# Altium schematic sheet R6 Schematic.SchDoc
size A4; SheetNumber: 1; SheetTotal: 1
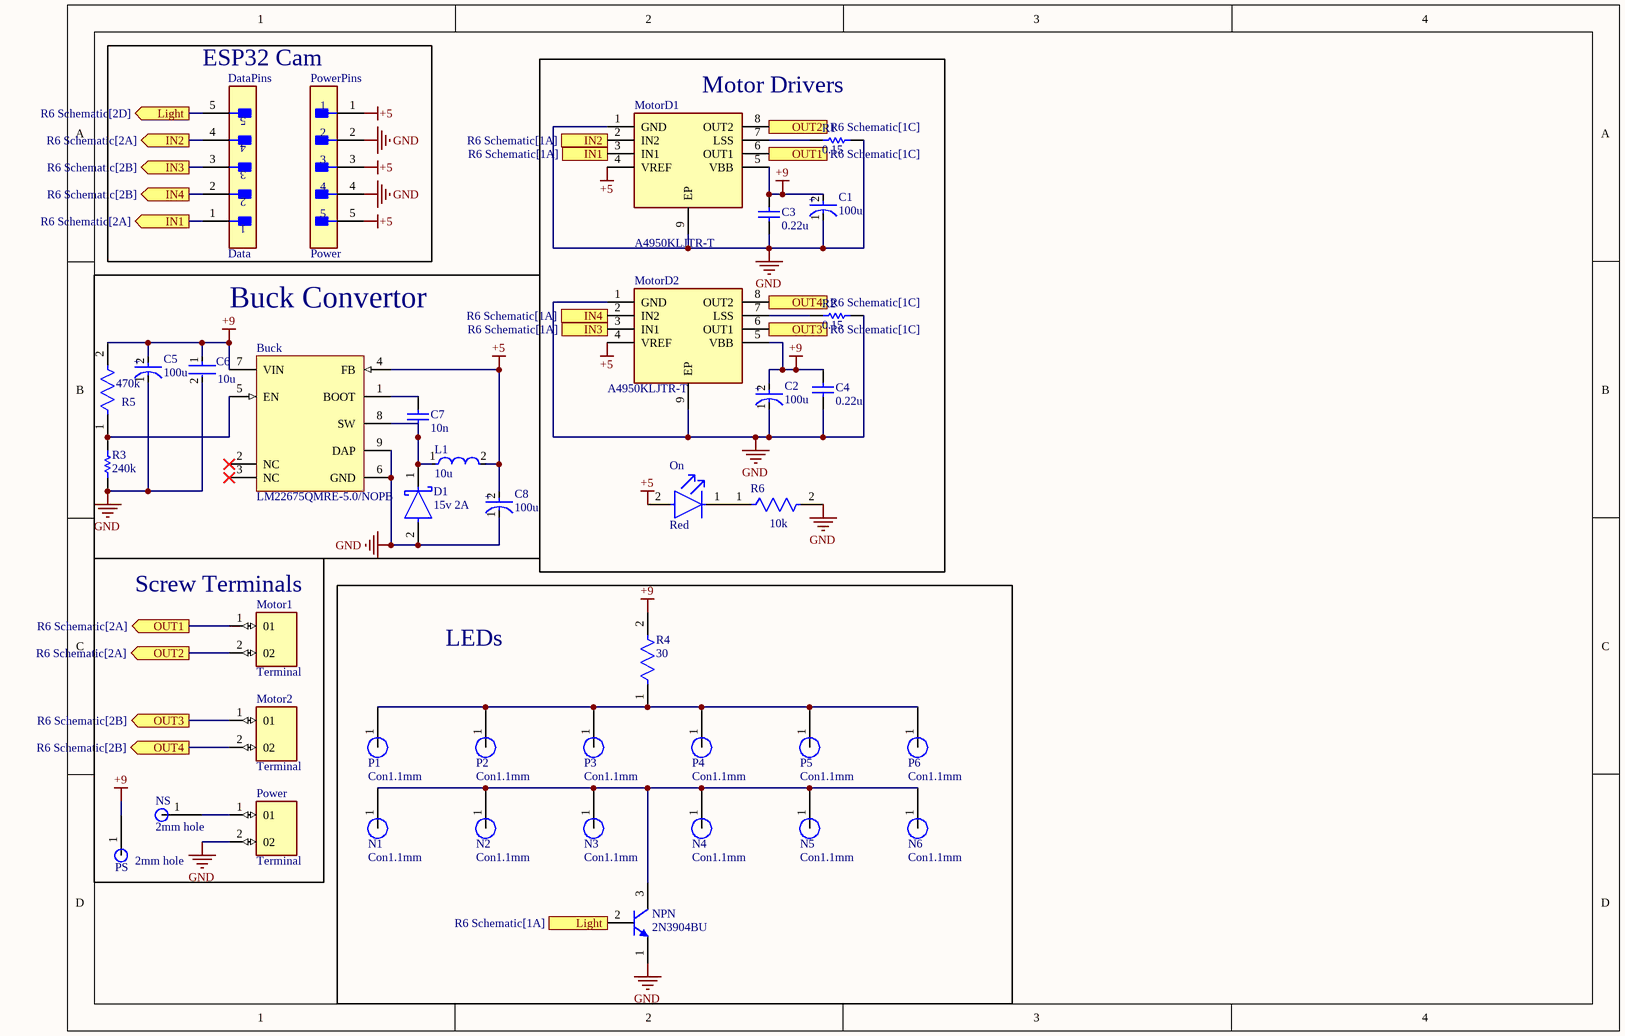
[diagram p0: R6 Schematic.SchDoc]

## Parts
Buck  LM22675QMRE-5.0/NOPB  [MRA08B_L]
C1  100u  [FP-FTB-MFG]
C2  100u  [FP-FTB-MFG]
C3  0.22u  [CAPC2013X94X50LL20T25]
C4  0.22u  [CAPC2013X94X50LL20T25]
C5  100u  [FP-FTB-MFG]
C6  10u  [FP-1210-L_3_3_0_4-W_2_5_0-IPC_A]
C7  10n  [CAPC1608X90X35ML15T15]
C8  100u  [FP-FTB-MFG]
D1  15v 2A  [FP-425AB-MFG]
DataPins  Data  [FP-22-28-4050-MFG]
L1  10u  [FP-IHLP-3232CZ-FP_2_413x5-MFG]
Motor1  Terminal  [EBBA-02-C-SS-BU]
Motor2  Terminal  [EBBA-02-C-SS-BU]
MotorD1  A4950KLJTR-T  [SOIC127P600X170-9N]
MotorD2  A4950KLJTR-T  [SOIC127P600X170-9N]
N1  Con1.1mm  [PCBComponent_1 - duplicate]
N2  Con1.1mm  [PCBComponent_1 - duplicate]
N3  Con1.1mm  [PCBComponent_1 - duplicate]
N4  Con1.1mm  [PCBComponent_1 - duplicate]
N5  Con1.1mm  [PCBComponent_1 - duplicate]
N6  Con1.1mm  [PCBComponent_1 - duplicate]
NPN  2N3904BU  [FAIR-TO-92]
NS  2mm hole  [PCBComponent_1]
On  Red  [FP-HSMC-C280-MFG]
P1  Con1.1mm  [PCBComponent_1 - duplicate]
P2  Con1.1mm  [PCBComponent_1 - duplicate]
P3  Con1.1mm  [PCBComponent_1 - duplicate]
P4  Con1.1mm  [PCBComponent_1 - duplicate]
P5  Con1.1mm  [PCBComponent_1 - duplicate]
P6  Con1.1mm  [PCBComponent_1 - duplicate]
Power  Terminal  [EBBA-02-C-SS-BU]
PowerPins  Power  [FP-22-28-4050-MFG]
PS  2mm hole  [PCBComponent_1]
R1  0.15  [RESC3216X89X64LL25T25]
R2  0.15  [RESC3216X89X64LL25T25]
R3  240k  [RESC0805(2012)_L]
R4  30  [FP-RMCF0805-IPC_B]
R5  470k  [FP-AT0805-IPC_C]
R6  10k  [FP-RQ731J-IPC_B]

## Blocks framed on the sheet
ESP32 Cam: DataPins PowerPins
Motor Drivers: C1-C4 MotorD1 MotorD2 On R1 R2 R6
Buck Convertor: Buck C5-C8 D1 L1 R3 R5
Screw Terminals: Motor1 Motor2 NS Power PS
LEDs: N1-N6 NPN P1-P6 R4

## Ports
IN1 (in, see R6 Schematic[1A]), IN1 (out, see R6 Schematic[2A]), IN2 (in, see R6 Schematic[1A]), IN2 (out, see R6 Schematic[2A]), IN3 (in, see R6 Schematic[1A]), IN3 (out, see R6 Schematic[2B]), IN4 (in, see R6 Schematic[1A]), IN4 (out, see R6 Schematic[2B]), Light (in, see R6 Schematic[1A]), Light (out, see R6 Schematic[2D]), OUT1 (out, see R6 Schematic[1C]), OUT1 (out, see R6 Schematic[2A]), OUT2 (out, see R6 Schematic[1C]), OUT2 (out, see R6 Schematic[2A]), OUT3 (out, see R6 Schematic[1C]), OUT3 (out, see R6 Schematic[2B]), OUT4 (out, see R6 Schematic[1C]), OUT4 (out, see R6 Schematic[2B])

## Nets
+5: Buck.4(FB) C8.2(A) L1.2 MotorD1.4(VREF) MotorD2.4(VREF) On.2(A) PowerPins.1 PowerPins.3 PowerPins.5
+9: Buck.7(VIN) C1.2(A) C2.2(A) C3.2 C4.2 C5.2(A) C6.1 MotorD1.5(VBB) MotorD2.5(VBB) PS.1 R4.2 R5.2
GND: Buck.6(GND) Buck.9(DAP) C1.1(C) C2.1(C) C3.1 C4.1 C5.1(C) C6.2 C8.1(C) D1.2(A) MotorD1.1(GND) MotorD1.9(EP) MotorD2.1(GND) MotorD2.9(EP) NPN.1(E) Power.2(02) PowerPins.2 PowerPins.4 R1.2 R2.2 R3.1 R6.2
IN1: DataPins.1 MotorD1.3(IN1) ; port IN1
IN2: DataPins.4 MotorD1.2(IN2) ; port IN2
IN3: DataPins.3 MotorD2.3(IN1) ; port IN3
IN4: DataPins.2 MotorD2.2(IN2) ; port IN4
Light: DataPins.5 NPN.2(B) ; port Light
OUT1: Motor1.1(01) MotorD1.6(OUT1) ; port OUT1
OUT2: Motor1.2(02) MotorD1.8(OUT2) ; port OUT2
OUT3: Motor2.1(01) MotorD2.6(OUT1) ; port OUT3
OUT4: Motor2.2(02) MotorD2.8(OUT2) ; port OUT4
NetBuck_1: Buck.1(BOOT) C7.2
NetBuck_5: Buck.5(EN) R3.2 R5.1
NetBuck_8: Buck.8(SW) C7.1 D1.1(C) L1.1
NetMotorD1_7: MotorD1.7(LSS) R1.1
NetMotorD2_7: MotorD2.7(LSS) R2.1
NetN1_1: N1.1 N2.1 N3.1 N4.1 N5.1 N6.1 NPN.3(C)
NetNS_1: NS.1 Power.1(01)
NetOn_1: On.1(C) R6.1
NetP1_1: P1.1 P2.1 P3.1 P4.1 P5.1 P6.1 R4.1

Not connected (* = marked no-connect by the designer): Buck 2(NC)* 3(NC)*

## Notes on the sheet
- (in symbol CMP-05427-000035-1) +

## Library data of the parts
Buck = CMP-0069-02125-1: 1A SIMPLE SWITCHER®, Step-Down Voltage Regulator with Precision Enable, 5V Output, Automotive Grade 1, 8-pin PSOP, 250 Reel; Manufacturer: National Semiconductor; PowerWise: N; PackageTopMarking: NSXYTT*L22675*Q5.0; CompType: Switcher; PinCount: 8; ComponentLink3URL: http://www.national.com/packaging/folders/mra08b.html; RoHS: Y; ComponentLink1URL: http://www.national.com/ds/LM/LM22675.pdf; PackageVersion: revB, Dec-2007; ComponentLink3Description: MRA08B Package Page; Code_JEDEC: MS-012-AA; PackageDescription: Molded, PSOP .193 x .154 x .058in, 8 Lead, .050in Pitch, Large DAP; ComponentLink2Description: LM22675 Web Page; DatasheetVersion: Dec-2010; ComponentLink1Description: LM22675 Datasheet; PackageReference: MRA08B; ComponentLink2URL: http://www.national.com/pf/LM/LM22675.html
C1 C2 C5 C8 = CMP-05427-000035-1: CAP ALUM 10UF 20% 50V SMD; Lead Diameter: 0.65mm; Ripple Current (AC): 85mA; Leakage Current: 5uA; Life (Hours): 2000Hour; Dielectric Material: Aluminium; ESR (Equivalent Series Resistance): 2.3R; Termination: SMD/SMT; Diameter: 4mm; Mount: Surface Mount; Lead Pitch: 1mm; Length: 5.8mm; Min Operating Temperature: -55°C; Capacitance: 10uF; Voltage Rating: 50V; RoHS Compliant: Yes; Package Quantity: 1; Voltage: 50V; Lead Free: Lead Free; Tolerance: 20%; Contact Plating: Tin; Ripple Current: 85mA; Radiation Hardening: No; Max Operating Temperature: 105°C; Series: FT; Voltage Rating (DC): 50V; Number of Pins: 2; Case/Package: Radial; Construction: Cylindrical; Height - Seated (Max): 0.24inch; Packaging: Tape and Reel; Height: 5.8mm
C3 C4 = CMP-2007-04183-1: Manufacturer: AVX Interconnect / Elco; Part Number: 08051C221JAT2A
C6 = CMP-1038-02198-3: CAP CER 10UF 10V X7R 1210; Dissipation Factor: 5%; Tolerance: 10%; Capacitance: 10uF; Voltage Rating (DC): 10V; Case Code (Imperial): 1210; Termination: SMD/SMT; Min Operating Temperature: -55°C; Max Operating Temperature: 125°C; Voltage: 10V; RoHS Compliant: Yes; Lead Free: Lead Free; Construction: Flat; Case/Package: 1210; Dielectric: X7R; Width: 0.098inch; REACH SVHC: No SVHC; Mount: Surface Mount; Case Code (Metric): 3225; Depth: 2.5mm; Series: 1210; Voltage Rating: 10V; Packaging: Tape and Reel; Length: 3.2mm; Thickness: 0.11inch; Package Quantity: 1; Height: 2.79mm; Radiation Hardening: No
C7 = CMP-2006-04466-1: Part Number: 06035G103ZAT2A; Manufacturer: AVX Interconnect / Elco
D1 = CMP-00278-84331612-1: SS22FA 2 A, 20 V Surface Mount Schottky Barrier Rectifiers; Manufacturer Lifecycle Status: ACTIVE; Max Forward Surge Current (Ifsm): 50A; Element Configuration: Single; Max Reverse Voltage (DC): 20V; Schedule B: 8541100080, 8541100080; Mount: Surface Mount; Weight: 19mg; Lifecycle Status: Production; Average Rectified Current: 2A; NexarPartId: 84331612; Forward Current: 2A; RoHS: Compliant; Max Repetitive Reverse Voltage (Vrrm): 20V
DataPins PowerPins = CMP-00257-00278173-1: 22-28-4050 KK® 254 Breakaway Header, Vertical, 5 Circuits, Tin (Sn) Plating, Mating Pin Length 6.09mm; NexarPartId: 278173; Voltage Rating: 250V; Number of Contacts: 5; Contact Resistance: 20mΩ; Gender: Male; Pitch: 2.54mm; Connector Type: Male Pin; Current Rating: 4A; Glow Wire Compliant: Non-compliant; Max Voltage Rating (DC): 250.25kV; Flammability Rating: UL94 V-0; Min Operating Temperature: 0°C; REACH SVHC: Unknown; Lead Free: Lead Free; Termination: Solder; RoHS: Compliant; Schedule B: 8536694040; Number of Circuits: 5; Mount: Through Hole; Lead Pitch: 2.54mm; Height: 2.29mm; Voltage Rating (DC): 250V; Max Operating Temperature: 75°C; Width: 2.49mm; Radiation Hardening: No; Contact Plating: Tin; Orientation: Vertical; Length: 12.7mm; Number of Rows: 1; Housing Material: Thermoplastic; Contact Material: Brass; Packaging: Bulk; Contact Mating Length: 6.096mm; Housing Color: Black; Color: Black; Number of Positions: 5
L1 = CMP-02424-000796-1: Commercial Inductors, High Saturation Series 10uH 4.7A 71.2mΩ 20%; Max DC Current: 8.2A; Core Material: Metal; Test Frequency: 100kHz; Shielding: Shielded; Self Resonant Frequency: 15MHz; DC Resistance (DCR): 71.2mR; Case/Package: 3232; Length: 8.64mm; Radiation Hardening: No; Width: 0.322inch; Package Quantity: 1000; Number of Pins: 2; Height - Seated (Max): 0.118inch; RoHS Compliant: Yes; Depth: 8.94mm; Inductance: 10uH; RMS Current (Irms): 4.7A; Min Operating Temperature: -55°C; Saturation Current: 8.2A; Max Operating Temperature: 125°C; Military Standard: Not; Packaging: Tape and Reel; Lead Free: Lead Free; Inductance Tolerance: 20%; Series: IHLP-3232CZ-01; Tolerance: 20%; Height: 3mm; Current Rating: 4.7A; Termination: SMD/SMT; Rated Current-Max: 4.7A; Mount: Surface Mount
Motor1 Motor2 Power = CMP-002-00072-2: Terminal block, EURO BLOCK, slotted screw, 5.00mm pitch, blue, 2 position; MF: Adam Tech; Check_prices: https://www.snapeda.com/parts/EBBA-02-C-SS-BU/Adam+Tech/view-part/?ref=eda; Design Item ID: EBBA-02-C-SS-BU; Case/Package: None; Source: EBBA-02-C-SS-BU.SchLib; MP: EBBA-02-C-SS-BU; SnapEDA_Link: https://www.snapeda.com/parts/EBBA-02-C-SS-BU/Adam+Tech/view-part/?ref=snap; Value: *; Component Type: Standard; Pins: 2
MotorD1 MotorD2 = A4950KLJTR-T: Integrated Circuit; Manufacturer_Name: Allegro Microsystems; Datasheet Link: https://www.allegromicro.com/~/media/Files/Datasheets/A4950-Datasheet.ashx; Height: 1.7mm; Manufacturer_Part_Number: A4950KLJTR-T; Mouser Part Number: 250-A4950KLJTR-T; Mouser Price/Stock: https://www.mouser.co.uk/ProductDetail/Allegro-MicroSystems/A4950KLJTR-T?qs=pUKx8fyJudCer0p7h%2FGGXA%3D%3D; Arrow Part Number: A4950KLJTR-T; Arrow Price/Stock: https://www.arrow.com/en/products/a4950kljtr-t/allegro-microsystems?region=nac
N1-N6 P1-P6 = Connector 1.1mm: Connector Pad 1.1mm
NPN = CMP-2000-04944-1: NPN General-Purpose Amplifier, 40 V VCEO, 0.2 A, -55 to 150 degC, 2-Pin TO-92, RoHS, Bulk; Manufacturer: FairchildSemiconductor; Maximum Collector Base Voltage: 60V; Minimum DC Current Gain: 40@0.1mA@1V; Maximum Collector Emitter Voltage: 40V; Maximum DC Collector Current: 0.2A; Rad Hard: No; Maximum Operating Frequency: 300(Min)MHz; Maximum Collector Emitter Saturation Voltage: 0.2@1mA@10mA; Maximum Power Dissipation: 625mW; Package Description: 3-Pin Transistor Outline Package, Body Dia 4.79 mm, Pitch 1.27 mm; Package Reference: TO-92; Pin Count: 3; Operating Temperature: -55to150degC; Category: GPBJT; Manufacturer URL: https://www.fairchildsemi.com/; Datasheet URL: https://datasheet.ciiva.com/4722/2n3904-82270-4722369.pdf; Package: 3TO-92; Packaging: Bulk; Type: NPN; Datasheet Version: Rev. 1.1.0, 10/2014; Mounting: ThroughHole
NS PS = Connector 2mm: 2mm Connector Hole
On = CMP-18399-000022-1: LED RED DIFFUSED 0402 SMD; Dominant Wavelength: 626nm; Number of Elements: 1; Luminous Intensity: 90mcd; Viewing Angle: 130°; Reverse Voltage: 5V; Forward Current: 20mA; Lens Color: White; Power Rating: 60mW; Forward Voltage: 1.9V; Luminous Flux: 155lm; Contact Plating: Gold; Number of Pins: 2; REACH SVHC: No SVHC; Lens Style: Diffused; Color: Red; Packaging: Tape and Reel; Max Operating Temperature: 85°C; Radiation Hardening: No; Length: 1mm; Number of LEDs: 1; Case/Package: 0402; Min Operating Temperature: -40°C; Case Code (Metric): 1005; Case Code (Imperial): 0402; Test Current: 20mA; Lead Free: Lead Free; Height: 0.4mm; Illumination Color: Red; Max Power Dissipation: 60mW; Package Quantity: 4000; Mount: Surface Mount; Wavelength: 626nm; Depth: 0.5mm; Lens Transparency: Diffused; Power Dissipation: 60mW; Width: 0.5mm
R1 R2 = CMP-2003-04328-1: Manufacturer: Vishay Dale; Part Number: WSL1206R1500FEA
R3 = CMP-1013-00777-1: 240K 0.125W 1% 0805 (2012 Metric)  SMD; Value: 240000.00 Ohm; Case-EIA: 0805; Case-Metric: 2012; Tolerance: 1 %; Technology: SMT; Power: 0.125 W
R4 = CMP-26527-003048-1: 30Ω ±5% 0.125W 0805 Thick Film Chip Resistor AEC-Q200 compliant; Max Power Dissipation: 125mW; Temperature Coefficient: 200ppm/°C; Resistance: 30R; Packaging: Tape and Reel; Max Operating Temperature: 155°C; Length: 0.079inch; Case/Package: 0805; Radiation Hardening: No; Military Standard: Not; Height: 0.026inch; Tolerance: 5%; Features: Automotive AEC-Q200; Case Code (Metric): 2012; Width: 0.049inch; Construction: Rectangular; RoHS Compliant: Yes; Min Operating Temperature: -55°C; Depth: 1.25mm; Series: RMCF; Case Code (Imperial): 0805; Number of Terminations: 2; Mount: Surface Mount; Resistor Type: Thick Film; Contact Plating: Tin
R5 = CMP-03412-042604-1: Thin Film Chip Resistors Automotive Grade 470kΩ 0.1% 25ppm/°C 0805
R6 = CMP-03211-011294-1: RQ73 0603 10KΩ  0.15W 10ppm/°C 0.1% 75V